# Altium schematic sheet 03_Boot_Memory.SchDoc
size A3; SheetNumber: 3; SheetTotal: 12
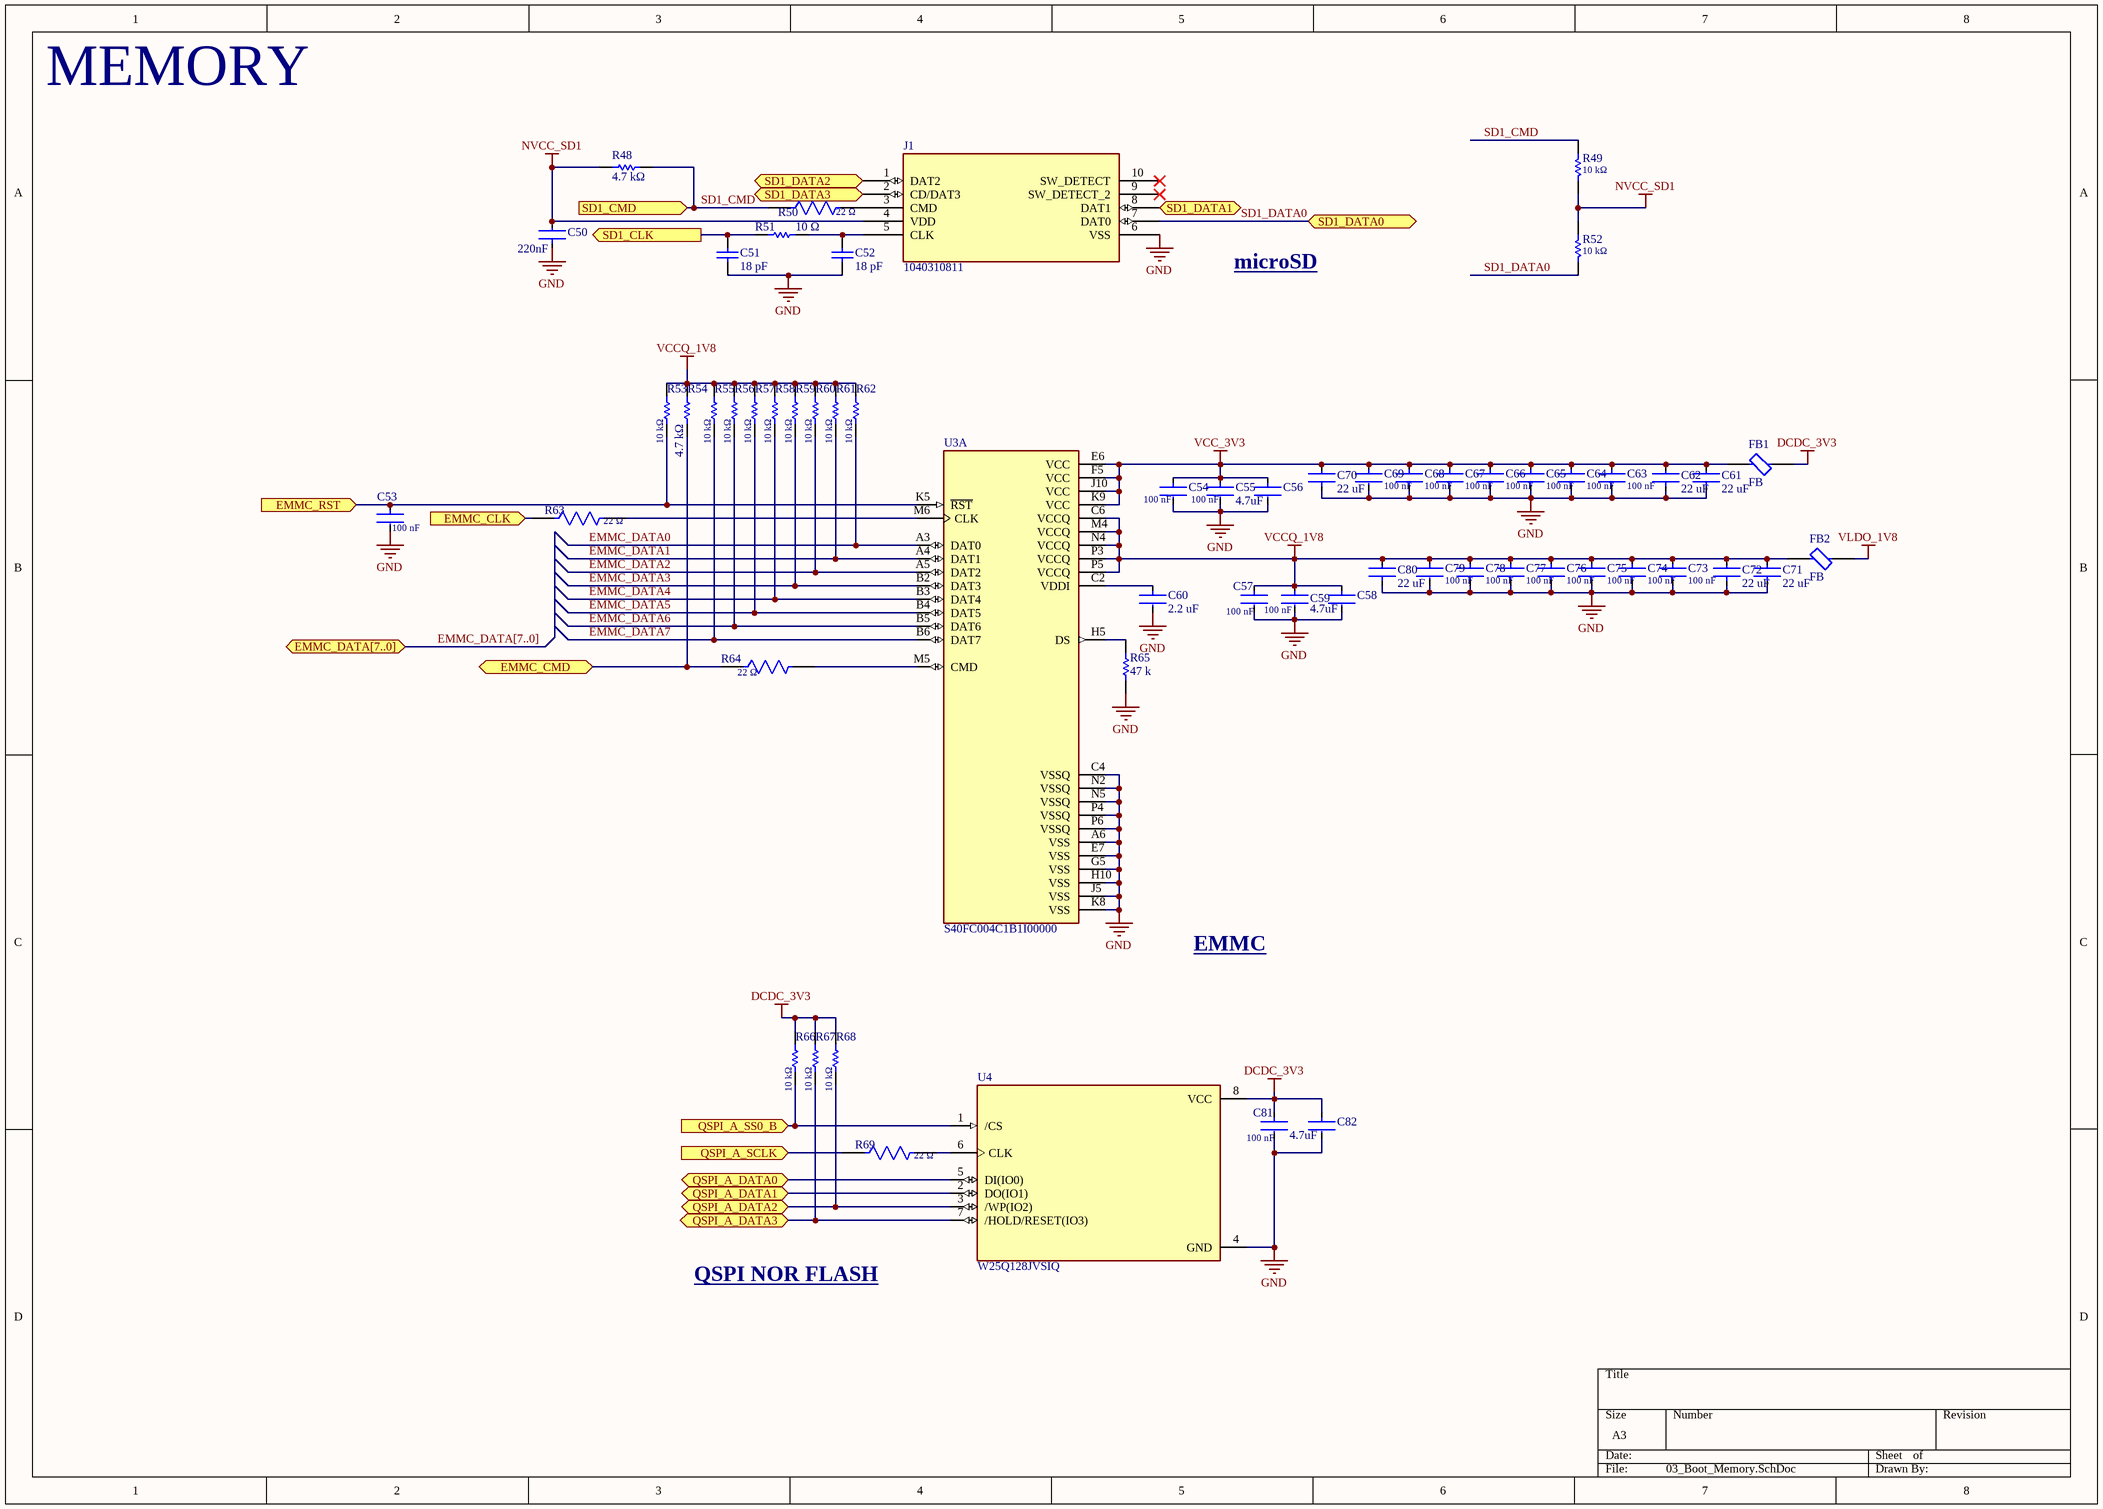
[diagram p0: 03_Boot_Memory.SchDoc]

## Parts
C50  220nF  [FP-CC0603-DA-MFG]
C51  18 pF  [CAPC1608X90X40NL10T20]
C52  18 pF  [CAPC1608X90X40NL10T20]
C53  100 nF  [FP-CC0603-DA-MFG]
C54  100 nF  [FP-CC0603-DA-MFG]
C55  100 nF  [FP-CC0603-DA-MFG]
C56  4.7uF  [FP-CC0603-DA-MFG]
C57  100 nF  [FP-CC0603-DA-MFG]
C58  4.7uF  [FP-CC0603-DA-MFG]
C59  100 nF  [FP-CC0603-DA-MFG]
C60  2.2 uF  [FP-CC0603-DA-MFG]
C61  22 uF  [FP-CC0603-DC-MFG]
C62  22 uF  [FP-CC0603-DC-MFG]
C63  100 nF  [FP-CC0603-DA-MFG]
C64  100 nF  [FP-CC0603-DA-MFG]
C65  100 nF  [FP-CC0603-DA-MFG]
C66  100 nF  [FP-CC0603-DA-MFG]
C67  100 nF  [FP-CC0603-DA-MFG]
C68  100 nF  [FP-CC0603-DA-MFG]
C69  100 nF  [FP-CC0603-DA-MFG]
C70  22 uF  [FP-CC0603-DC-MFG]
C71  22 uF  [FP-CC0603-DC-MFG]
C72  22 uF  [FP-CC0603-DC-MFG]
C73  100 nF  [FP-CC0603-DA-MFG]
C74  100 nF  [FP-CC0603-DA-MFG]
C75  100 nF  [FP-CC0603-DA-MFG]
C76  100 nF  [FP-CC0603-DA-MFG]
C77  100 nF  [FP-CC0603-DA-MFG]
C78  100 nF  [FP-CC0603-DA-MFG]
C79  100 nF  [FP-CC0603-DA-MFG]
C80  22 uF  [FP-CC0603-DC-MFG]
C81  100 nF  [FP-CC0603-DA-MFG]
C82  4.7uF  [FP-CC0603-DA-MFG]
FB1  FB  [FP-BLM21-0_2-t0_85-e0_5-IPC_C]
FB2  FB  [FP-BLM21-0_2-t0_85-e0_5-IPC_C]
J1  1040310811  [104031-0811_MOL]
R48  4.7 kΩ  [RESC1608X55X25LL10T15]
R49  10 kΩ  [RESC1608X55X25ML10T15]
R50  22 Ω  [FP-RC0603-0_55-IPC_C]
R51  10 Ω  [RESC2013X60X35ML10T20]
R52  10 kΩ  [RESC1608X55X25ML10T15]
R53  10 kΩ  [RESC1608X55X25ML10T15]
R54  4.7 kΩ  [RESC1608X55X25LL10T15]
R55  10 kΩ  [RESC1608X55X25ML10T15]
R56  10 kΩ  [RESC1608X55X25ML10T15]
R57  10 kΩ  [RESC1608X55X25ML10T15]
R58  10 kΩ  [RESC1608X55X25ML10T15]
R59  10 kΩ  [RESC1608X55X25ML10T15]
R60  10 kΩ  [RESC1608X55X25ML10T15]
R61  10 kΩ  [RESC1608X55X25ML10T15]
R62  10 kΩ  [RESC1608X55X25ML10T15]
R63  22 Ω  [FP-RC0603-0_55-IPC_C]
R64  22 Ω  [FP-RC0603-0_55-IPC_C]
R65  47 k  [RESC1608X55X25LL10T15]
R66  10 kΩ  [RESC1608X55X25ML10T15]
R67  10 kΩ  [RESC1608X55X25ML10T15]
R68  10 kΩ  [RESC1608X55X25ML10T15]
R69  22 Ω  [FP-RC0603-0_55-IPC_C]
U3  S40FC004C1B1I00000  [BGA153N50P14X14_1150X1300X80]  (part A of 3)
U4  W25Q128JVSIQ  [SOIC127P790X216-8N]

## Ports
EMMC_CLK (in), EMMC_CMD (bidir), EMMC_DATA[7..0] (bidir), EMMC_RST (in), QSPI_A_DATA0 (bidir), QSPI_A_DATA1 (bidir), QSPI_A_DATA2 (bidir), QSPI_A_DATA3 (bidir), QSPI_A_SCLK (in), QSPI_A_SS0_B (in), SD1_CLK (out), SD1_CMD (in), SD1_DATA0 (bidir), SD1_DATA1 (bidir), SD1_DATA2 (bidir), SD1_DATA3 (bidir)

## Nets
DCDC_3V3: C81.1 C82.1 FB1.1 R66.1 R67.1 R68.1 U4.8(VCC)
GND: C50.1 C51.1 C52.1 C53.2 C54.2 C55.2 C56.2 C57.2 C58.2 C59.2 C60.2 C61.1 C62.1 C63.2 C64.2 C65.2 C66.2 C67.2 C68.2 C69.2 C70.1 C71.1 C72.1 C73.2 C74.2 C75.2 C76.2 C77.2 C78.2 C79.2 C80.1 C81.2 C82.2 J1.6(VSS) R65.1 U3.A6(VSS) U3.C4(VSSQ) U3.E7(VSS) U3.G5(VSS) U3.H10(VSS) U3.J5(VSS) U3.K8(VSS) U3.N2(VSSQ) U3.N5(VSSQ) U3.P4(VSSQ) U3.P6(VSSQ) U4.4(GND)
NVCC_SD1: C50.2 J1.4(VDD) R48.2 R49.2 R52.1
VCC_3V3: C54.1 C55.1 C56.1 C61.2 C62.2 C63.1 C64.1 C65.1 C66.1 C67.1 C68.1 C69.1 C70.2 FB1.2 U3.E6(VCC) U3.F5(VCC) U3.J10(VCC) U3.K9(VCC)
VCCQ_1V8: C57.1 C58.1 C59.1 C71.2 C72.2 C73.1 C74.1 C75.1 C76.1 C77.1 C78.1 C79.1 C80.2 FB2.2 R53.1 R54.2 R55.1 R56.1 R57.1 R58.1 R59.1 R60.1 R61.1 R62.1 U3.C6(VCCQ) U3.M4(VCCQ) U3.N4(VCCQ) U3.P3(VCCQ) U3.P5(VCCQ)
VLDO_1V8: FB2.1
EMMC_CLK: R63.1 ; port EMMC_CLK
EMMC_CMD: R54.1 R64.1 ; port EMMC_CMD
EMMC_DATA0: R62.2 U3.A3(DAT0)
EMMC_DATA1: R61.2 U3.A4(DAT1)
EMMC_DATA2: R60.2 U3.A5(DAT2)
EMMC_DATA3: R59.2 U3.B2(DAT3)
EMMC_DATA4: R58.2 U3.B3(DAT4)
EMMC_DATA5: R57.2 U3.B4(DAT5)
EMMC_DATA6: R56.2 U3.B5(DAT6)
EMMC_DATA7: R55.2 U3.B6(DAT7)
EMMC_RST: C53.1 R53.2 U3.K5(~{RST}) ; port EMMC_RST
QSPI_A_DATA0: U4.5(DI(IO0)) ; port QSPI_A_DATA0
QSPI_A_DATA1: U4.2(DO(IO1)) ; port QSPI_A_DATA1
QSPI_A_DATA2: R68.2 U4.3(/WP(IO2)) ; port QSPI_A_DATA2
QSPI_A_DATA3: R67.2 U4.7(/HOLD/RESET(IO3)) ; port QSPI_A_DATA3
QSPI_A_SCLK: R69.1 ; port QSPI_A_SCLK
QSPI_A_SS0_B: R66.2 U4.1(/CS) ; port QSPI_A_SS0_B
SD1_CLK: C51.2 R51.1 ; port SD1_CLK
SD1_CMD: R48.1 R49.1 R50.1 ; port SD1_CMD
SD1_DATA0: J1.7(DAT0) R52.2 ; port SD1_DATA0
SD1_DATA1: J1.8(DAT1) ; port SD1_DATA1
SD1_DATA2: J1.1(DAT2) ; port SD1_DATA2
SD1_DATA3: J1.2(CD/DAT3) ; port SD1_DATA3
NetC52_2: C52.2 J1.5(CLK) R51.2
NetC60_1: C60.1 U3.C2(VDDI)
NetJ1_3: J1.3(CMD) R50.2
NetR63_2: R63.2 U3.M6(CLK)
NetR64_2: R64.2 U3.M5(CMD)
NetR65_2: R65.2 U3.H5(DS)
NetR69_2: R69.2 U4.6(CLK)

Not connected (* = marked no-connect by the designer): J1 9(SW_DETECT_2)* 10(SW_DETECT)*

## Buses and harness runs
bus EMMC_DATA[7..0] = port EMMC_DATA[7..0]

## Notes on the sheet
- MEMORY
- microSD
- EMMC
- QSPI NOR FLASH

## Library data of the parts
C50 = CMP-03422-001373-1: 0.22µF 50V Ceramic Capacitor X7R 0603 (1608 Metric) 0.063" L x 0.031" W (1.60mm x 0.80mm); Manufacturer Part Number: CC0603KRX7R9BB224; Manufacturer: YAGEO; Tolerance: 0.1; Temperature Coefficient: 15%; ComponentLink2URL: http://www.yageo.com/documents/recent/UPY-GPHC_X7R_6.3V-to-50V_18.pdf; Temperature Range High: +125°C; Lead Free: Yes; Mouser Description: 0603 50 V 0.22 uF ±10% Tolerance X7R Multilayer Ceramic Capacitor; Material: Ceramic; Value: 220 nF; Temperature Range Low: -55°C; Digikey Description: 0.22µF 50V Ceramic Capacitor X7R 0603 (1608 Metric) 0.063" L x 0.031" W (1.60mm x 0.80mm); Device Class L3: Ceramic Capacitors; RoHS: TRUE; Octopart: https://octopart.com/cc0603krx7r9bb224-yageo-30314039; Package: CC0603-DA; Device Class L1: Passive Components; Automotive: No; Voltage: 50 V; Height: 0.9mm; Device Class L2: Capacitors; Voltage Rating: 50 V; Temperature: -55°C to +125°C; Footprint Url: http://www.yageo.com/exep/pages/download/literatures/UPY-C_GEN_24.pdf; Category: Cap; Capacitance: 220 nF; ComponentLink2Description: Datasheet; Temperature Characteristic: X7R
C51 C52 = CMP-1659-00030-1: Chip Capacitor, 18 pF, +/- 5%, 50 V, -55 to 125 degC, 0603 (1608 Metric), RoHS, Tape and Reel; Voltage Rating: 50 V; Case\Package: 0603; Power Rating: 100 mW; Resistance: 68.1 Ohm; Tolerance: 1%; Case Code (Metric): 1608; Max Operating Temperature: 155 degC; RoHSCompliant: true; Case Code (Imperial): 0603; ComponentLink2Description: Datasheet; Package Quantity: 200; PackageReference: 0603; ComponentLink2URL: http://www.yageo.com/NewPortal/yageodocoutput?fileName=/pdf/MLCC/UPY-GP_NP0_16V-to-50V_14.pdf; Length: 1.6 mm; DatasheetVersion: Rev. 14, 07/2016; Min Operating Temperature: -55 degC; ComponentLink1URL: http://www.yageo.com/; Width: 0.8 mm; ComponentLink1Description: Manufacturer URL; Height: 0.45 mm; Radiation Hardening: No; PackageDescription: 2-Pin Surface Mount Device, Body 1.6 x 0.8 mm; Packaging: Tape and Reel
C53-C55 C57 C59 C63-C69 C73-C79 C81 = CMP-2100-03601-2: CAP CER 0.1UF 50V X7R 0603; Manufacturer: YAGEO; Manufacturer Part Number: CC0603KRX7R9BB104; Material: Ceramic; Temperature Coefficient: 15%; Tolerance: 0.1; Height: 0.9mm; Voltage: 50 V; ComponentLink2Description: Datasheet; Device Class L2: Capacitors; Temperature Range High: +125°C; Category: Cap; Capacitance: 100 nF; Footprint Url: http://www.yageo.com/exep/pages/download/literatures/UPY-C_GEN_24.pdf; ComponentLink2URL: http://www.yageo.com/documents/recent/UPY-GPHC_X7R_6.3V-to-50V_18.pdf; Package: CC0603-DA; Temperature: -55°C to +125°C; Voltage Rating: 50 V; Temperature Characteristic: X7R; Device Class L1: Passive Components; Temperature Range Low: -55°C; RoHS: TRUE; Automotive: No; Value: 100 nF; Device Class L3: Ceramic Capacitors; Octopart: https://octopart.com/cc0603krx7r9bb104-yageo-42244635; Mouser Description: Multilayer Ceramic Capacitor, CC Series, 0.1 - F, - 10%, X7R, 50 V, 0603 [1608 Metric]; Lead Free: Yes; Digikey Description: CAP CER 0.1UF 50V X7R 0603
C56 C58 C82 = CMP-2000-06074-2: CAP CER 4.7UF 10V X5R 0603; Manufacturer Part Number: CC0603KRX5R6BB475; Manufacturer: YAGEO; Temperature Coefficient: 15%; Tolerance: 0.1; Material: Ceramic; Voltage Rating: 10 V; ComponentLink2URL: http://www.yageo.com/documents/recent/UPY-GPHC_X7R_6.3V-to-50V_18.pdf; Package: CC0603-DA; Temperature Range High: +125°C; Category: Cap; ComponentLink2Description: Datasheet; Lead Free: Yes; Mouser Description: 4.7µF Surface Mount, MLCC 0603 (1608 Metric) Package Ceramic Capacitors; Device Class L2: Capacitors; Temperature Characteristic: X5R; Voltage: 10 V; RoHS: TRUE; Octopart: https://octopart.com/cc0603krx5r6bb475-yageo-9292507; Automotive: No; Height: 0.9mm; Temperature: -55°C to +125°C; Temperature Range Low: -55°C; Value: 4.7 uF; Digikey Description: CAP CER 4.7UF 10V X5R 0603; Device Class L1: Passive Components; Capacitance: 4.7 uF; Footprint Url: http://www.yageo.com/exep/pages/download/literatures/UPY-C_GEN_24.pdf; Device Class L3: Ceramic Capacitors
C60 = CMP-2000-06073-2: CAP CER 2.2UF 10V X5R 0603; Manufacturer: YAGEO; Manufacturer Part Number: CC0603KRX5R6BB225; Tolerance: 0.1; Temperature Coefficient: 15%; Material: Ceramic; Lead Free: Yes; Temperature: -55°C to +125°C; Category: Cap; Device Class L2: Capacitors; Device Class L3: Ceramic Capacitors; Voltage: 10 V; RoHS: TRUE; Octopart: https://octopart.com/cc0603krx5r6bb225-yageo-8376528; Temperature Characteristic: X5R; Capacitance: 2.2 uF; ComponentLink2URL: http://www.yageo.com/documents/recent/UPY-GPHC_X7R_6.3V-to-50V_18.pdf; Package: CC0603-DA; Footprint Url: http://www.yageo.com/exep/pages/download/literatures/UPY-C_GEN_24.pdf; Device Class L1: Passive Components; Digikey Description: CAP CER 2.2UF 10V X5R 0603; Temperature Range Low: -55°C; ComponentLink2Description: Datasheet; Value: 2.2 uF; Mouser Description: Multilayer Ceramic Capacitors MLCC - SMD/SMT 2.2uF 10V X5R 10%; Temperature Range High: +125°C; Height: 0.9mm; Voltage Rating: 10 V; Automotive: No
C61 C62 C70-C72 C80 = CMP-2000-06075-2: CAP CER 22UF 6.3V X5R 0603; Tolerance: 20%; Termination: SMD/SMT; Mount: Surface Mount; Depth: 0.8mm; Thickness: 0.035inch; Packaging: Tape and Reel; RoHS Compliant: Yes; Case/Package: 0603; Min Operating Temperature: -55°C; Package Quantity: 4000; Weight: 7.1E-05oz; Max Operating Temperature: 85°C; Voltage Rating (DC): 6.3V; Halogen Free: Halogen Free; Lead Free: Lead Free; Resistor Type: Ceramic; Case Code (Imperial): 0603; Width: 0.031inch; Case Code (Metric): 1608; Voltage Rating: 6.3V; Length: 0.063inch; Capacitance: 22uF; Dielectric: X5R
FB1 FB2 = CMP-0686-00653-3: Chip Ferrite Bead, 0805, 2200Ω @ 100MHz, 0.6Ω, 25%, 200mA; DC Resistance (DCR): 600mR; Shielding: Unshielded; Number of Lines: 1; Impedance: 2.2kR; Material: Steel; Number of Pins: 2; Termination: SMD/SMT; Frequency: 100MHz; Package Quantity: 1; Max Operating Temperature: 125°C; Test Frequency: 100MHz; Case/Package: 0805; Height: 0.85mm; Core Material: Ferrite; Current Rating: 200mA; Resistance: 600mR; Lead Free: Lead Free; REACH SVHC: No SVHC; Length: 2mm; Min Operating Temperature: -55°C; Packaging: Tape and Reel; Weight: 0.000194oz; Series: BLM21B; Max Current Rating: 200mA; Width: 1.25mm; Tolerance: 25%; Depth: 1.25mm; RoHS Compliant: Yes; DC Resistance-Max: 600MR; Case Code (Metric): 2012; Case Code (Imperial): 0805; Number of Circuits: 1; Max DC Current: 200mA
J1 = 1040310811: MF: {'manufacturer': u'Molex'}; Package: None; Price: None; Value: *; MP: 1040310811; Availability: Unavailable
R48 R54 = CMP-2000-06942-1: Chip Resistor, 4.7 KOhm, +/- 1%, 0.1 W, -55 to 155 degC, 0603 (1608 Metric), RoHS, Tape and Reel; Manufacturer: Yageo; Power Rating: 100mW; Temperature Coefficient: 100PPM/C; Resistance: 4.7kOhms; Voltage Rating: 50V; Package Reference: 0603; Series: RC; Datasheet Version: Rev. 7, 05/2017; Packaging: Reel; Termination Style: SMD/SMT; Datasheet URL: http://www.yageo.com/documents/recent/PYu-RC_Group_51_RoHS_L_7.pdf; Manufacturer URL: http://www.yageo.com/; Package Description: 2-Pin Surface Mount Device, Body 1.6 x 0.8 mm; Case Code - mm: 1608; Case Code - in: 0603; Mounting Technology: SurfaceMount; Operating Temperature Range: -55Cto+155C; Tolerance: 1%; Product: ThickFilmResistorsGeneralPurpose
R49 R52 R53 R55-R62 R66-R68 = CMP-2000-05022-1: Resistor, 10 KOhm, +/- 5%, 100 mW, -55 to 155 degC, 0603 (1608 Metric), RoHS, Tape and Reel; Manufacturer: Yageo; Resistance: 10kOhms; Voltage Rating: 50V; Temperature Coefficient: 100PPM/C; Power Rating: 100mW; Package Reference: 603; Series: RC; Case Code - mm: 1608; Packaging: Reel; Datasheet URL: http://www.farnell.com/datasheets/443971.pdf; Datasheet Version: Rev. 4, 04/2009; Operating Temperature Range: -55Cto+155C; Product: ThickFilmResistorsGeneralPurpose; Package Description: 2-Pin Surface Mount Device, Body 1.6 x 0.8 mm; Manufacturer URL: http://www.yageo.com/; Case Code - in: 0603; Tolerance: 5%; Termination Style: SMD/SMT
R50 R63 R64 R69 = CMP-03412-037819-1: RES SMD 22 OHM 5% 1/10W 0603; Temperature Coefficient: 100ppm/°C; Max Power Dissipation: 100mW; Voltage Rating: 50V; Resistance: 22R; Length: 1.6mm; Tolerance: 5%; Resistance Tolerance: 5%; Number of Terminations: 2; Construction: Rectangular; Min Operating Temperature: -55°C; Lead Free: Lead Free; Width: 0.8mm; Case Code (Imperial): 0603; Voltage Rating (DC): 50V; Case/Package: 0603; Features: Moisture Resistant; REACH SVHC: No SVHC; Military Standard: Not; RoHS Compliant: Yes; Max Operating Temperature: 155°C; Number of Pins: 2; Termination: SMD/SMT; Case Code (Metric): 1608; Packaging: Tape and Reel; Resistor Type: Thick Film; Depth: 0.8mm; Size Code: 0603; Power Rating: 100mW; Series: RC
R51 = CMP-2100-03670-1: Chip Resistor, 10 Ohm, +/- 1%, 0.125 W, -55 to 155 degC, 0805 (2012 Metric), RoHS, Tape and Reel; Manufacturer: Yageo; Resistance: 10Ohm; Power Rating: 125mW; Voltage Rating: 150V; Temperature Coefficient: 200ppm/degreesC; Number of Pins: 2; REACH SVHC: NoSVHC; Datasheet Version: Rev. 5, 10/2016; Max Operating Temperature: 155degC; Manufacturer URL: http://www.yageo.com/; Case Code (Imperial): 0805; Package Description: 2-Pin Surface Mounted Device, Body 2 x 1.25 mm; Case Code (Metric): 2012; Length: 2mm; RoHSCompliant: true; Max Power Dissipation: 125mW; Depth: 1.25mm; Packaging: TapeandReel; Height: 0.5mm; Package Reference: 0805; Package Quantity: 1; Tolerance: 1%; Termination: SMD/SMT; Min Operating Temperature: -55degC; Lead Free: LeadFree; Width: 1.25mm; Voltage Rating (DC): 150V; Datasheet URL: http://www.yageo.com/NewPortal/yageodocoutput?fileName=/pdf/R-Chip/PYu-RC_Group_51_RoHS_L_5.pdf; Composition: ThickFilm; Number of Terminations: 2; Case/Package: 0805
R65 = CMP-2000-04221-1: Part Number: RC0603FR-1347KL; Manufacturer: Yageo
U3 = S40FC004C1B1I00000: 4GB e.MMC Flash v5.1 Vcc 2.7 V - 3.6 V (13 x 11.5 x 0.8mm) I-Temp - FBGA-153; MF: SkyHigh Memory; SnapEDA_Link: https://www.snapeda.com/parts/S40FC004C1B1I00000/SkyHigh+Memory/view-part/?ref=snap; Package: None; Value: *; MP: S40FC004C1B1I00000; Check_prices: https://www.snapeda.com/parts/S40FC004C1B1I00000/SkyHigh+Memory/view-part/?ref=eda
U4 = W25Q128JVSIQ: FLASH - NOR Memory IC 128Mb (16M x 8) SPI - Quad I/O, QPI, DTR 133 MHz 8-SOIC; MF: Winbond Electronics; SnapEDA_Link: https://www.snapeda.com/parts/W25Q128JVSIQ/Winbond/view-part/?ref=snap; Package: SOIC-8 Winbond Electronics; Value: *; MP: W25Q128JVSIQ; Check_prices: https://www.snapeda.com/parts/W25Q128JVSIQ/Winbond/view-part/?ref=eda